# EasyEDA Pro project travellium-12v-desktop-power-supply-cc8d8467.epro, schematic EG1163S_C_1
Board Name: EG1163S_C_1; Create Date: 2024-10-08; Page Name: EG1163S_C_SCH; Project Name: 12V 30A 360W桌面DCDC电源; Schematic Name: EG1163S_C_1; Update Date: 2024-10-08; Company: 嘉立创EDA; Page Size: A4; Version: V1.0
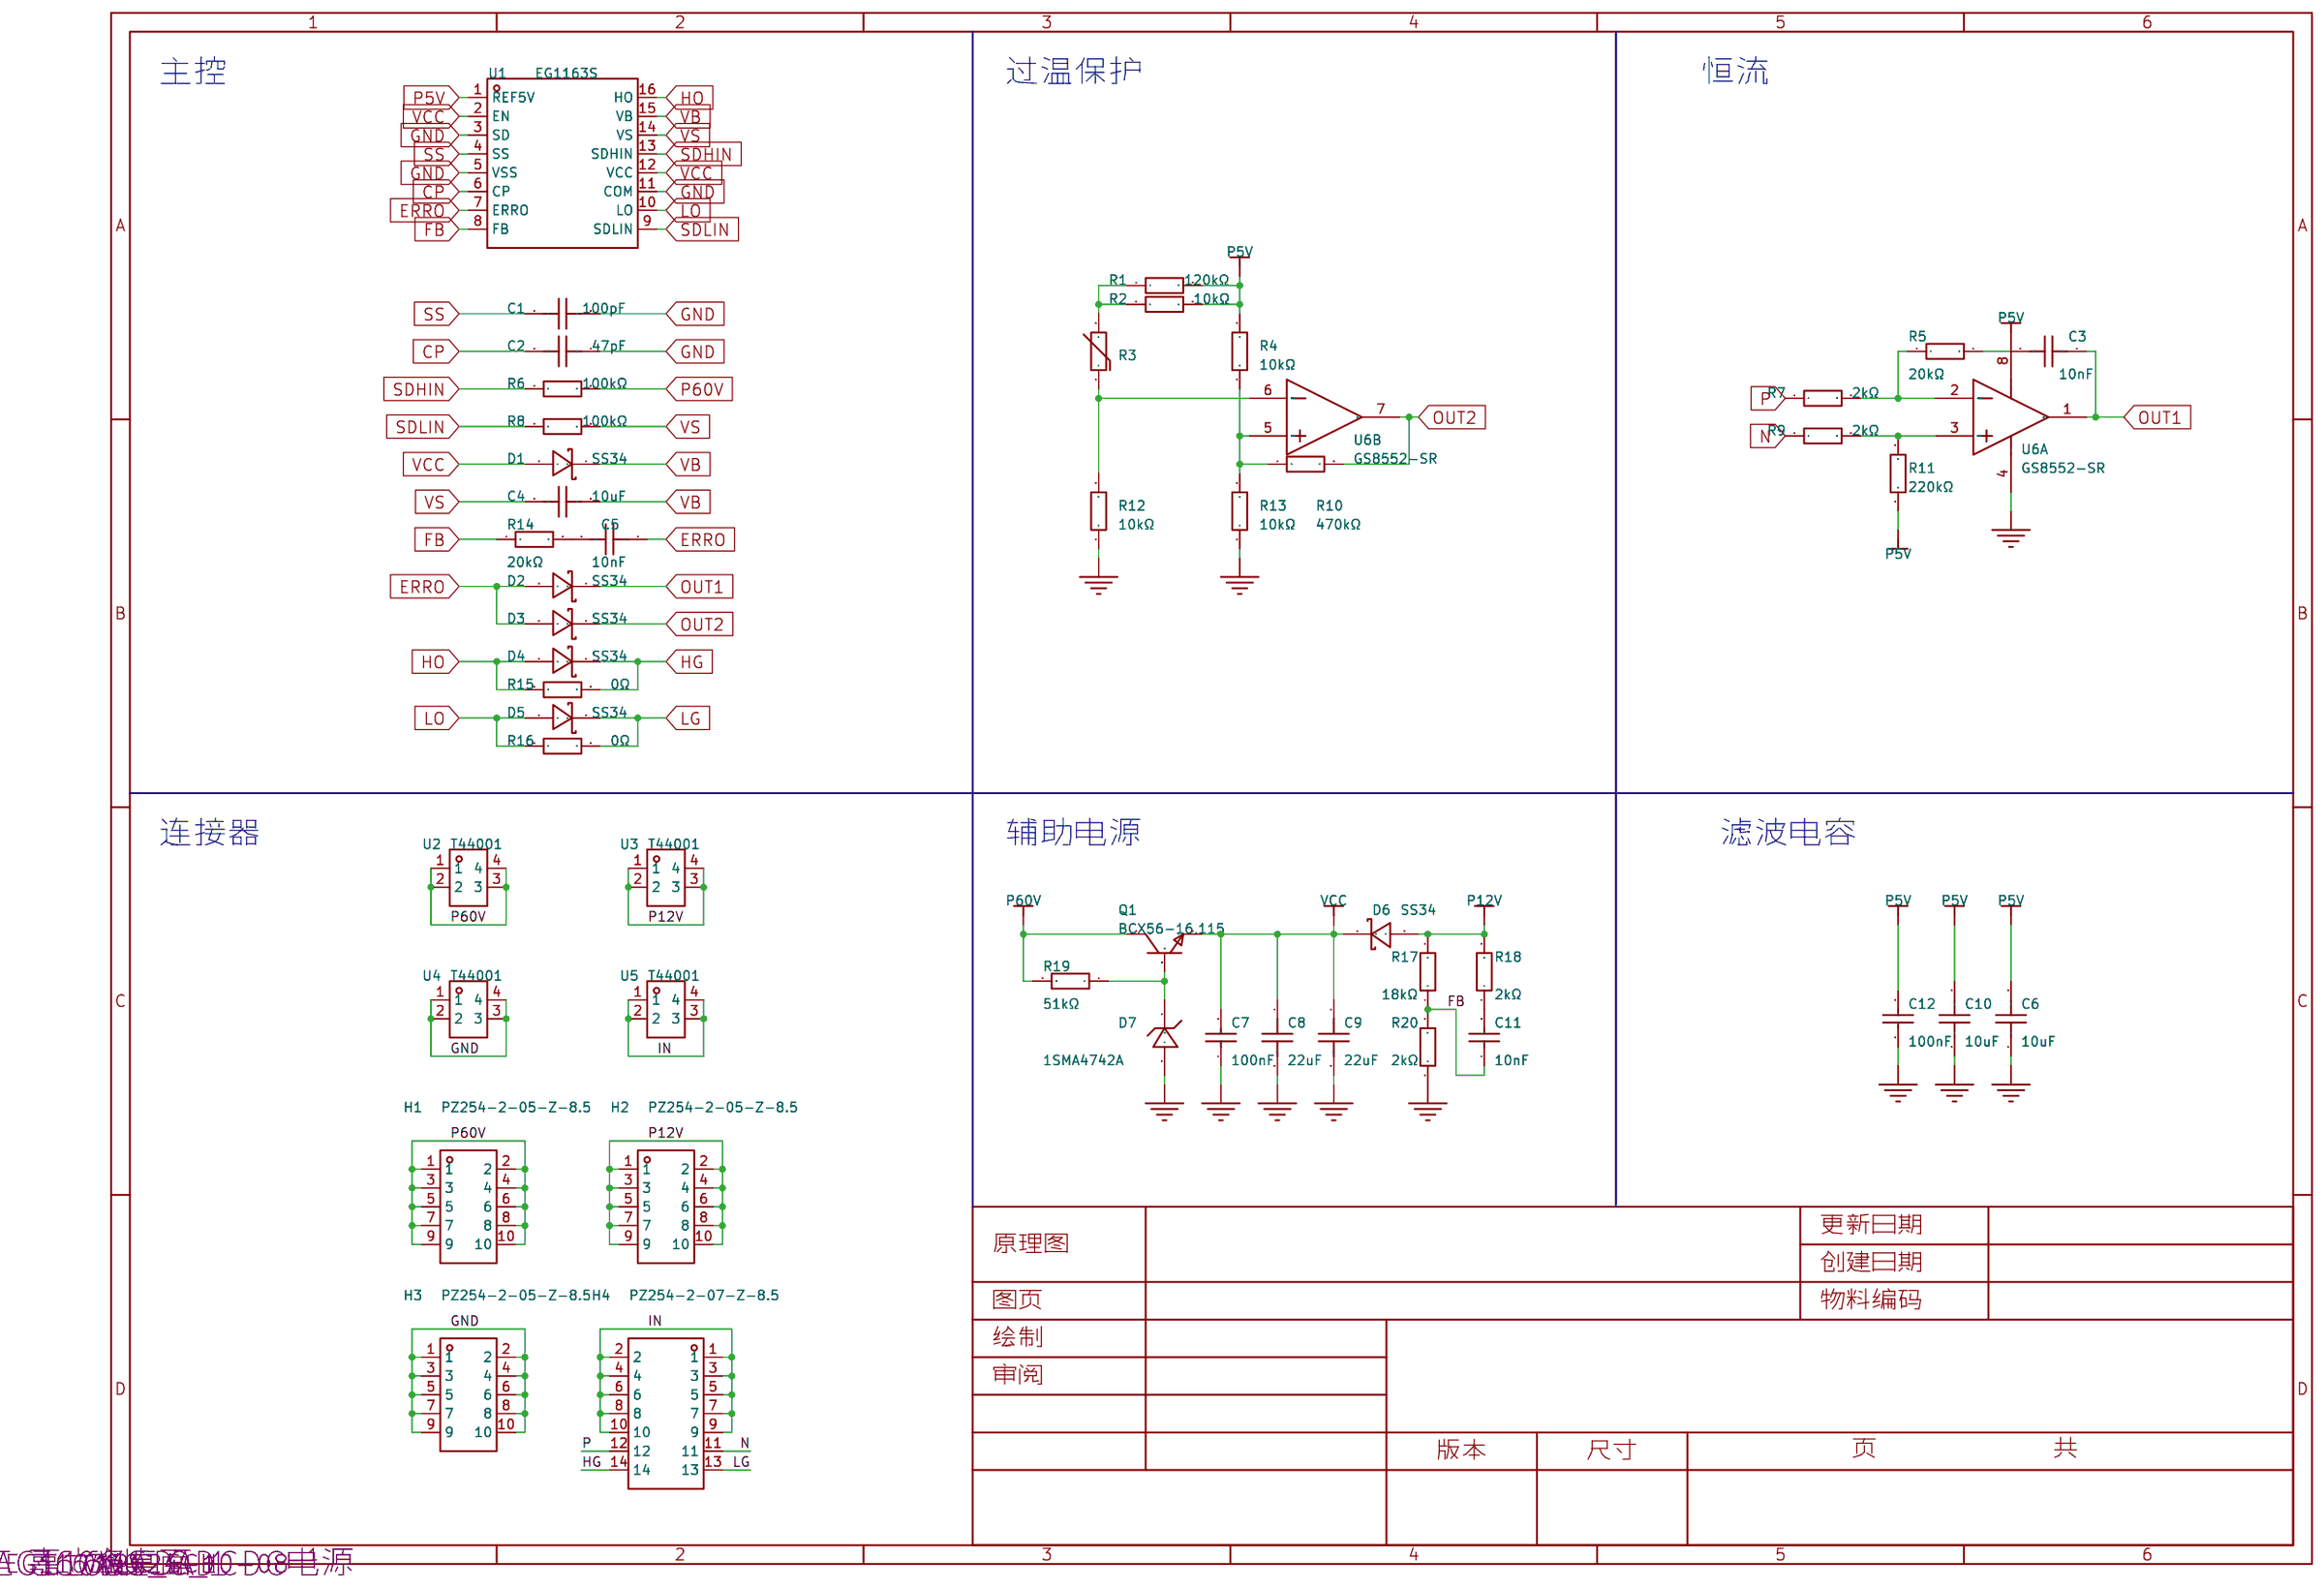
[diagram p1: schematic sheet]

## Parts
C1  100pF  [C0805]
C2  47pF  [C0805]
C3  10nF  [C0805]
C4  10uF  [C1210]
C5  10nF  [C0805]
C6  10uF  [C1210]
C7  100nF  [C1206]
C8  22uF  [C0805]
C9  22uF  [C0805]
C10  10uF  [C1210]
C11  10nF  [C0805]
C12  100nF  [C1206]
D1  SS34  [SMA_L4.3-W2.6-LS5.2-RD]
D2  SS34  [SMA_L4.3-W2.6-LS5.2-RD]
D3  SS34  [SMA_L4.3-W2.6-LS5.2-RD]
D4  SS34  [SMA_L4.3-W2.6-LS5.2-RD]
D5  SS34  [SMA_L4.3-W2.6-LS5.2-RD]
D6  SS34  [SMA_L4.3-W2.6-LS5.2-RD]
D7  1SMA4742A  [SMA_L4.4-W2.6-LS5.0-RD]
H1  PZ254-2-05-Z-8.5  [HDR-TH_10P-P2.54-V-M-R2-C5-S2.54]
H2  PZ254-2-05-Z-8.5  [HDR-TH_10P-P2.54-V-M-R2-C5-S2.54]
H3  PZ254-2-05-Z-8.5  [HDR-TH_10P-P2.54-V-M-R2-C5-S2.54]
H4  PZ254-2-07-Z-8.5  [HDR-TH_14P-P2.54-V-M-R2-C7-S2.54]
Q1  BCX56-16,115  [SOT-89-3_L4.5-W2.5-P1.50-LS4.1-TL-CW]
R1  120kΩ  [R0805]
R2  10kΩ  [R0805]
R3  SDNT2012X103F3950FTF  [R0805]
R4  10kΩ  [R0805]
R5  20kΩ  [R0805]
R6  100kΩ  [R0805]
R7  2kΩ  [R0805]
R8  100kΩ  [R0805]
R9  2kΩ  [R0805]
R10  470kΩ  [R0805]
R11  220kΩ  [R0805]
R12  10kΩ  [R0805]
R13  10kΩ  [R0805]
R14  20kΩ  [R0805]
R15  0Ω  [R0805]
R16  0Ω  [R0805]
R17  18kΩ  [R0805]
R18  2kΩ  [R0805]
R19  51kΩ  [R1206]
R20  2kΩ  [R0805]
U1  EG1163S  [SOP-16_L10.0-W3.9-P1.27-LS6.0-BL]
U2  T44001  [CONN-TH_T44001]  (no BOM)
U3  T44001  [CONN-TH_T44001]  (no BOM)
U4  T44001  [CONN-TH_T44001]  (no BOM)
U5  T44001  [CONN-TH_T44001]  (no BOM)
U6  GS8552-SR  [SOIC-8_L4.9-W3.9-P1.27-LS6.0-BL]  (sections 1,2)

## Library data of the parts
C1 = 0805CG101J500NT: 容值:100pF;精度:±5%;额定电压:50V;材质(温度系数):C0G;; LCSC Part Name: 100pF ±5% 50V; Supplier Part: C82028; Manufacturer: FH(风华); Supplier Footprint: 0805; Datasheet: https://atta.szlcsc.com/upload/public/pdf/source/20200305/C486355_26A10D38EF8C2A5C37091D0039909270.pdf; Supplier: LCSC; Tolerance: ±5%; Voltage Rated: 50V; Temperature Coefficient: C0G
C2 = 0805CG470J500NT: 容值:47pF;精度:±5%;额定电压:50V;材质(温度系数):C0G;; LCSC Part Name: 47pF ±5% 50V; Supplier Part: C24659; Manufacturer: FH(风华); Supplier Footprint: 0805; Datasheet: https://atta.szlcsc.com/upload/public/pdf/source/20140310/1457707011918.pdf; Supplier: LCSC; Tolerance: ±5%; Voltage Rated: 50V; Temperature Coefficient: C0G
C3 C5 = CC0805KRX7R9BB103: 容值:10nF;精度:±10%;额定电压:50V;材质(温度系数):X7R;; LCSC Part Name: 10nF ±10% 50V; Supplier Part: C83170; Manufacturer: YAGEO(国巨); Supplier Footprint: 0805; Datasheet: https://atta.szlcsc.com/upload/public/pdf/source/20170211/1486785656773.pdf; Supplier: LCSC; Tolerance: ±10%; Voltage Rated: 50V; Temperature Coefficient: X7R
C4 C6 C10 = C1210X7R106K101NT: 容值:10uF;精度:±10%;额定电压:100V;材质(温度系数):-;; LCSC Part Name: 10uF ±10% 100V; Supplier Part: C2844385; Manufacturer: SANYEAR(叁叶源); Supplier Footprint: 1210; Datasheet: https://atta.szlcsc.com/upload/public/pdf/source/20200102/C475251_1E30ECAC0E8AE7254982658A02A2D78C.pdf; Supplier: LCSC; Tolerance: ±10%; Voltage Rated: 100V
C7 C12 = 1206B104K101NT: 容值:100nF;精度:±10%;额定电压:100V;材质(温度系数):X7R;; LCSC Part Name: 100nF ±10% 100V; Supplier Part: C110255; Manufacturer: FH(风华); Supplier Footprint: 1206; Datasheet: https://atta.szlcsc.com/upload/public/pdf/source/20200305/C486355_26A10D38EF8C2A5C37091D0039909270.pdf; Supplier: LCSC; Tolerance: ±10%; Voltage Rated: 100V; Temperature Coefficient: X7R
C8 C9 = CGA0805X5R226M350MT: 容值:22uF;精度:±20%;额定电压:35V;材质(温度系数):X5R;; LCSC Part Name: 22uF ±20% 35V; Supplier Part: C6119901; Manufacturer: HRE(芯声); Supplier Footprint: 0805; Datasheet: https://atta.szlcsc.com/upload/public/pdf/source/20231129/D589D0CC4D260F7AC3A77E53B455CCB3.pdf; Supplier: LCSC; Tolerance: ±20%; Voltage Rated: 35V; Temperature Coefficient: X5R
C11 = CL21B103KBANNNC: 容值:10nF;精度:±10%;额定电压:50V;材质(温度系数):X7R;; LCSC Part Name: 10nF ±10% 50V; Supplier Part: C1710; Manufacturer: SAMSUNG(三星); Supplier Footprint: 0805; Datasheet: https://atta.szlcsc.com/upload/public/pdf/source/20160218/1457707763339.pdf; Supplier: LCSC; Tolerance: ±10%; Voltage Rated: 50V; Temperature Coefficient: X7R
D1-D6 = SS34_C8678: 二极管配置:独立式;正向压降(Vf):550mV@3A;直流反向耐压(Vr):40V;整流电流:3A;; LCSC Part Name: 电压:40V 电流:3A; Supplier Part: C8678; Manufacturer: MDD(辰达半导体); Supplier Footprint: SMA(DO-214AC); Datasheet: https://atta.szlcsc.com/upload/public/pdf/source/20230314/A80AE34493C69B89E2F4B1712F433538.pdf; Supplier: LCSC; Diode Configuration: 独立式; Forward Voltage (Vf@If): 550mV@3A; Reverse Voltage (Vr): 40V; Rectified Current: 3A; Reverse Leakage Current (Ir): 500uA@40V
D7 = 1SMA4742A: 二极管配置:独立式;稳压值(标称值):12V;稳压值(范围):11.4V~12.6V;功率:1W;精度:±5%;; LCSC Part Name: 齐纳二极管 12V 1W; Supplier Part: C382772; Manufacturer: 晶导微电子; Supplier Footprint: SMA; Datasheet: https://atta.szlcsc.com/upload/public/pdf/source/20191016/C438379_D516EA6EC0252B18A685B1726D67BD37.pdf; Supplier: LCSC; Diode Configuration: 独立式; Zener Voltage (Nom): 12V; Reverse Leakage Current (Ir): 5uA@9V; Zener Voltage (Range): 11.4V~12.6V; Power Dissipation: 1W; Zener Impedance (Zzt): 9Ω; Tolerance: ±5%
H1-H3 = PZ254-2-05-Z-8.5_C2894966: 插针结构:2x5P;间距:2.54mm;行距:2.54mm;圆针/方针:方针;安装类型:直插;排数:双排;总PIN位数:10P;额定电流:3A;额定电压:-;配合针长度:6mm;塑高:2.5mm;端接针长度:3mm;触头材质:黄铜;工作温度范围:-40℃~+105℃;焊接温度(最大值):260℃@10S;颜色:黑色;; LCSC Part Name: 2x5P 间距:2.54mm 方针 直插; Supplier Part: C2894966; Manufacturer: HCTL(华灿天禄); Supplier Footprint: 插件,P=2.54mm; Datasheet: https://atta.szlcsc.com/upload/public/pdf/source/20230609/5BA09C8BEB9B31376F8BF6032FF67CAC.pdf; Supplier: LCSC; Pin Structure: 2x5P; Pitch: 2.54mm; Row Spacing: 2.54mm; Circluar Pins/Square Pins: 方针; Mounting Type: 直插; Number of Rows: 双排; Number of Pins: 10P; Current Rating (Max): 3A; Length of Mating Pin: 6mm; Insulation Height: 2.5mm; Length of End Connection Pin: 3mm; Contact Material: 黄铜; Operating Temperature Range: -40℃~+105℃; Soldering Temperature(Max): 260℃@10S; Color: 黑色
H4 = PZ254-2-07-Z-8.5: 插针结构:2x7P;间距:2.54mm;行距:2.54mm;圆针/方针:方针;安装类型:直插;排数:双排;总PIN位数:14P;额定电流:3A;额定电压:-;配合针长度:6mm;塑高:2.5mm;端接针长度:3mm;触头材质:黄铜;工作温度范围:-40℃~+105℃;焊接温度(最大值):260℃@10S;颜色:黑色;; LCSC Part Name: 2x7P 间距:2.54mm 方针 直插; Supplier Part: C2894968; Manufacturer: HCTL(华灿天禄); Supplier Footprint: 插件,P=2.54mm; Datasheet: https://atta.szlcsc.com/upload/public/pdf/source/20230609/5BA09C8BEB9B31376F8BF6032FF67CAC.pdf; Supplier: LCSC; Pin Structure: 2x7P; Pitch: 2.54mm; Row Spacing: 2.54mm; Circluar Pins/Square Pins: 方针; Mounting Type: 直插; Number of Rows: 双排; Number of Pins: 14P; Current Rating (Max): 3A; Length of Mating Pin: 6mm; Insulation Height: 2.5mm; Length of End Connection Pin: 3mm; Contact Material: 黄铜; Operating Temperature Range: -40℃~+105℃; Soldering Temperature(Max): 260℃@10S; Color: 黑色
Q1 = BCX56-16,115: 晶体管类型:NPN;集电极电流(Ic):1A;集射极击穿电压(Vceo):80V;功率(Pd):1.25W;直流电流增益(hFE@Ic,Vce):100@150mA,2V;; LCSC Part Name: NPN 电流:1A 耐压:80V; Supplier Part: C100026; Manufacturer: Nexperia(安世); Supplier Footprint: SOT-89-3; JLCPCB Part Class: 扩展库; Datasheet: https://atta.szlcsc.com/upload/public/pdf/source/20180622/C192156_DE6B14924783BD7199E60C522C027552.pdf; Supplier: LCSC; Transistor Type: NPN; Collector Current (Ic): 1A; Collector-Emitter Breakdown Voltage (Vceo): 80V; Power Dissipation (Pd): 1.25W; DC Current Gain (hFE@Ic,Vce): 100@150mA,2V; Transition Frequency (fT): 180MHz; Collector Cut-Off Current (Icbo): 100nA; Collector-Emitter Saturation Voltage (VCE(sat)@Ic,Ib): 500mV@500mA,50mA
R1 = 0805W8F1203T5E: 电阻类型:厚膜电阻;阻值:120kΩ;精度:±1%;功率:125mW;最大工作电压:150V;温度系数:±100ppm/℃;; LCSC Part Name: 120kΩ ±1% 125mW 厚膜电阻; Supplier Part: C17436; Manufacturer: UNI-ROYAL(厚声); Supplier Footprint: 0805; Datasheet: https://atta.szlcsc.com/upload/public/pdf/source/20200306/C422600_1E6D84923E4A46A82E41ADD87F860B5C.pdf; Supplier: LCSC; Type: 厚膜电阻; Tolerance: ±1%; Power(Watts): 125mW; Overload Voltage (Max): 150V; Temperature Coefficient: ±100ppm/℃; Operating Temperature Range: -55℃~+155℃
R2 R4 R12 R13 = 0805W8F1002T5E_C17414: 电阻类型:厚膜电阻;阻值:10kΩ;精度:±1%;功率:125mW;最大工作电压:150V;温度系数:±100ppm/℃;; LCSC Part Name: 10kΩ ±1% 125mW 厚膜电阻; Supplier Part: C17414; Manufacturer: UNI-ROYAL(厚声); Manufacturer Part: 0805W8F1002T5E; Supplier Footprint: 0805; JLCPCB Part Class: 基础库; Datasheet: https://atta.szlcsc.com/upload/public/pdf/source/20200306/C422600_1E6D84923E4A46A82E41ADD87F860B5C.pdf; Supplier: LCSC; Type: 厚膜电阻; Tolerance: ±1%; Power(Watts): 125mW; Overload Voltage (Max): 150V; Temperature Coefficient: ±100ppm/℃; Operating Temperature Range: -55℃~+155℃
R3 = SDNT2012X103F3950FTF: 阻值(25℃):10kΩ;B值(25℃/50℃):3950K;电阻精度:±1%;功率:200mW;B值精度:±1%;最大稳态电流(25℃):440uA;; LCSC Part Name: 10kΩ 电阻精度:±1% 3950K; Supplier Part: C95968; Manufacturer: Sunlord(顺络); Supplier Footprint: 0805; Datasheet: https://atta.szlcsc.com/upload/public/pdf/source/20210916/BF106A3565EDFEB141CB3E0EA3A661F8.pdf; Supplier: LCSC; Resistance @ 25℃: 10kΩ; B Constant (25℃/50℃): 3950K; Resistance Tolerance: ±1%; Power: 200mW; B Constant Tolerance: ±1%; Steady State Current (Max): 440uA; Operating Temperature: -55℃~+125℃
R5 R14 = 0805W8F2002T5E: 电阻类型:厚膜电阻;阻值:20kΩ;精度:±1%;功率:125mW;最大工作电压:150V;温度系数:±100ppm/℃;; LCSC Part Name: 20kΩ ±1% 125mW 厚膜电阻; Supplier Part: C4328; Manufacturer: UNI-ROYAL(厚声); Supplier Footprint: 0805; Datasheet: https://atta.szlcsc.com/upload/public/pdf/source/20200306/C422600_1E6D84923E4A46A82E41ADD87F860B5C.pdf; Supplier: LCSC; Type: 厚膜电阻; Tolerance: ±1%; Power(Watts): 125mW; Overload Voltage (Max): 150V; Temperature Coefficient: ±100ppm/℃; Operating Temperature Range: -55℃~+155℃
R6 R8 = 0805W8F1003T5E: 电阻类型:厚膜电阻;阻值:100kΩ;精度:±1%;功率:125mW;最大工作电压:150V;温度系数:±100ppm/℃;; LCSC Part Name: 100kΩ ±1% 125mW 厚膜电阻; Supplier Part: C149504; Manufacturer: UNI-ROYAL(厚声); Supplier Footprint: 0805; Datasheet: https://atta.szlcsc.com/upload/public/pdf/source/20200306/C422600_1E6D84923E4A46A82E41ADD87F860B5C.pdf; Supplier: LCSC; Type: 厚膜电阻; Tolerance: ±1%; Power(Watts): 125mW; Overload Voltage (Max): 150V; Temperature Coefficient: ±100ppm/℃; Operating Temperature Range: -55℃~+155℃
R7 R9 R18 R20 = 0805W8F2001T5E: 电阻类型:厚膜电阻;阻值:2kΩ;精度:±1%;功率:125mW;最大工作电压:150V;温度系数:±100ppm/℃;; LCSC Part Name: 2kΩ ±1% 125mW 厚膜电阻; Supplier Part: C17604; Manufacturer: UNI-ROYAL(厚声); Supplier Footprint: 0805; Datasheet: https://atta.szlcsc.com/upload/public/pdf/source/20200306/C422600_1E6D84923E4A46A82E41ADD87F860B5C.pdf; Supplier: LCSC; Type: 厚膜电阻; Tolerance: ±1%; Power(Watts): 125mW; Overload Voltage (Max): 150V; Temperature Coefficient: ±100ppm/℃; Operating Temperature Range: -55℃~+155℃
R10 = 0805W8F4703T5E: 电阻类型:厚膜电阻;阻值:470kΩ;精度:±1%;功率:125mW;最大工作电压:150V;温度系数:±100ppm/℃;; LCSC Part Name: 470kΩ ±1% 125mW 厚膜电阻; Supplier Part: C17709; Manufacturer: UNI-ROYAL(厚声); Supplier Footprint: 0805; JLCPCB Part Class: 基础库; Datasheet: https://atta.szlcsc.com/upload/public/pdf/source/20200306/C422600_1E6D84923E4A46A82E41ADD87F860B5C.pdf; Supplier: LCSC; Type: 厚膜电阻; Tolerance: ±1%; Power(Watts): 125mW; Overload Voltage (Max): 150V; Temperature Coefficient: ±100ppm/℃; Operating Temperature Range: -55℃~+155℃
R11 = 0805W8F2203T5E: 电阻类型:厚膜电阻;阻值:220kΩ;精度:±1%;功率:125mW;最大工作电压:150V;温度系数:±100ppm/℃;; LCSC Part Name: 220kΩ ±1% 125mW 厚膜电阻; Supplier Part: C17556; Manufacturer: UNI-ROYAL(厚声); Supplier Footprint: 0805; JLCPCB Part Class: 基础库; Datasheet: https://atta.szlcsc.com/upload/public/pdf/source/20200306/C422600_1E6D84923E4A46A82E41ADD87F860B5C.pdf; Supplier: LCSC; Type: 厚膜电阻; Tolerance: ±1%; Power(Watts): 125mW; Overload Voltage (Max): 150V; Temperature Coefficient: ±100ppm/℃; Operating Temperature Range: -55℃~+155℃
R15 R16 = 0805W8F0000T5E: 电阻类型:厚膜电阻;阻值:0Ω;精度:±1%;功率:125mW;最大工作电压:150V;温度系数:±800ppm/℃;; LCSC Part Name: 0Ω ±1% 125mW 厚膜电阻; Supplier Part: C17477; Manufacturer: UNI-ROYAL(厚声); Supplier Footprint: 0805; Datasheet: https://atta.szlcsc.com/upload/public/pdf/source/20200306/C422600_1E6D84923E4A46A82E41ADD87F860B5C.pdf; Supplier: LCSC; Type: 厚膜电阻; Tolerance: ±1%; Power(Watts): 125mW; Overload Voltage (Max): 150V; Temperature Coefficient: ±800ppm/℃; Operating Temperature Range: -55℃~+155℃
R17 = 0805W8F1802T5E: 电阻类型:厚膜电阻;阻值:18kΩ;精度:±1%;功率:125mW;最大工作电压:150V;温度系数:±100ppm/℃;; LCSC Part Name: 18kΩ ±1% 125mW 厚膜电阻; Supplier Part: C17506; Manufacturer: UNI-ROYAL(厚声); Supplier Footprint: 0805; JLCPCB Part Class: 扩展库; Datasheet: https://atta.szlcsc.com/upload/public/pdf/source/20200306/C422600_1E6D84923E4A46A82E41ADD87F860B5C.pdf; Supplier: LCSC; Type: 厚膜电阻; Tolerance: ±1%; Power(Watts): 125mW; Overload Voltage (Max): 150V; Temperature Coefficient: ±100ppm/℃; Operating Temperature Range: -55℃~+155℃
R19 = 1206W4F5102T5E: 电阻类型:厚膜电阻;阻值:51kΩ;精度:±1%;功率:250mW;最大工作电压:200V;温度系数:±100ppm/℃;; LCSC Part Name: 51kΩ ±1% 250mW 厚膜电阻; Supplier Part: C17992; Manufacturer: UNI-ROYAL(厚声); Supplier Footprint: 1206; Datasheet: https://atta.szlcsc.com/upload/public/pdf/source/20200306/C422600_1E6D84923E4A46A82E41ADD87F860B5C.pdf; Supplier: LCSC; Type: 厚膜电阻; Tolerance: ±1%; Power(Watts): 250mW; Overload Voltage (Max): 200V; Temperature Coefficient: ±100ppm/℃; Operating Temperature Range: -55℃~+155℃
U1 = EG1163S: Supplier Part: C480648; Manufacturer: EG(屹晶微); Supplier Footprint: SOP-16; Datasheet: https://atta.szlcsc.com/upload/public/pdf/source/20200107/C480648_B4005FBE962858BB3952B17669789646.pdf; Supplier: LCSC
U2-U5 = T44001: LCSC Part Name: 四脚 M4 二件套; Supplier Part: C481447; Manufacturer: XFCN(兴飞); Supplier Footprint: 插件; Datasheet: https://atta.szlcsc.com/upload/public/pdf/source/20200107/C481448_4214B4EB74A46B70BD82BA8A456D4EDD.pdf; Supplier: LCSC
U6 = GS8552-SR: 放大器数:双路;增益带宽积(GBP):1.8MHz;压摆率(SR):0.95V/us;; Supplier Part: C157716; Manufacturer: Gainsil(聚洵); Supplier Footprint: SOIC-8; Datasheet: https://atta.szlcsc.com/upload/public/pdf/source/20200615/C605420_EE0E567F8FF01D919583B114644E1CC3.pdf; Supplier: LCSC; Number of Circuits: 双路; Gain Bandwidth Product(GBP): 1.8MHz; Slew Rate(SR): 0.95V/us; Supply Voltage: 1.8V~5.5V; Supply Current: 180uA; Operating Temperature: -40℃~+125℃

## Nets
GND: C1.2 C2.1 C6.1 C7.1 C8.2 C9.2 C10.1 C12.1 D7.2(A) H3.1 H3.2 H3.3 H3.4 H3.5 H3.6 H3.7 H3.8 H3.9 H3.10 R12.1 R13.1 R20.1 U1.3(SD) U1.5(VSS) U1.11(COM) U4.1 U4.2 U4.3 U4.4 U6.4(-V)
P5V: C6.2 C10.2 C12.2 R1.2 R2.1 R4.2 R11.1 U1.1(REF5V) U6.8(+V)
P12V: D6.2(A) H2.1 H2.2 H2.3 H2.4 H2.5 H2.6 H2.7 H2.8 H2.9 H2.10 R17.2 R18.2 U3.1 U3.2 U3.3 U3.4
P60V: H1.1 H1.2 H1.3 H1.4 H1.5 H1.6 H1.7 H1.8 H1.9 H1.10 Q1.2 R6.2 R19.2 U2.1 U2.2 U2.3 U2.4
VCC: C7.2 C8.1 C9.1 D1.2(A) D6.1(K) Q1.1 U1.2(EN) U1.12(VCC)
CP: C2.2 U1.6(CP)
ERRO: C5.1 D2.2(A) D3.2(A) U1.7(ERRO)
FB: C11.1 R14.1 R17.1 R20.2 U1.8(FB)
HG: D4.1(K) H4.14 R15.2
HO: D4.2(A) R15.1 U1.16(HO)
IN: H4.1 H4.2 H4.3 H4.4 H4.5 H4.6 H4.7 H4.8 H4.9 H4.10 U5.1 U5.2 U5.3 U5.4
LG: D5.1(K) H4.13 R16.2
LO: D5.2(A) R16.1 U1.10(LO)
N: H4.11 R9.1
OUT1: C3.1 D2.1(K) U6.1(OUT)
OUT2: D3.1(K) R10.2 U6.7(OUT)
P: H4.12 R7.1
SDHIN: R6.1 U1.13(SDHIN)
SDLIN: R8.1 U1.9(SDLIN)
SS: C1.1 U1.4(SS)
VB: C4.1 D1.1(K) U1.15(VB)
VS: C4.2 R8.2 U1.14(VS)
$1N6441: C5.2 R14.2
$1N6469: R5.1 R7.2 U6.2(INVERTING INPUT)
$1N6473: R9.2 R11.2 U6.3(NONINVERTING INPUT)
$1N6474: R4.1 R10.1 R13.2 U6.5(NONINVERTING INPUT)
$1N6479: C3.2 R5.2
$1N6504: D7.1(C) Q1.3 R19.1
$1N22064: C11.2 R18.1
Net-(R1-1): R1.1 R2.2 R3.2
Net-(R3-1): R3.1 R12.2 U6.6(INVERTING INPUT)

## Notes on the sheet
- 主控
- 过温保护
- 恒流
- 连接器
- 辅助电源
- 滤波电容
